# Altium schematic sheet HDMI_Sheet.SchDoc
size A4; DocumentNumber: 12; SheetNumber: 12; SheetTotal: 27
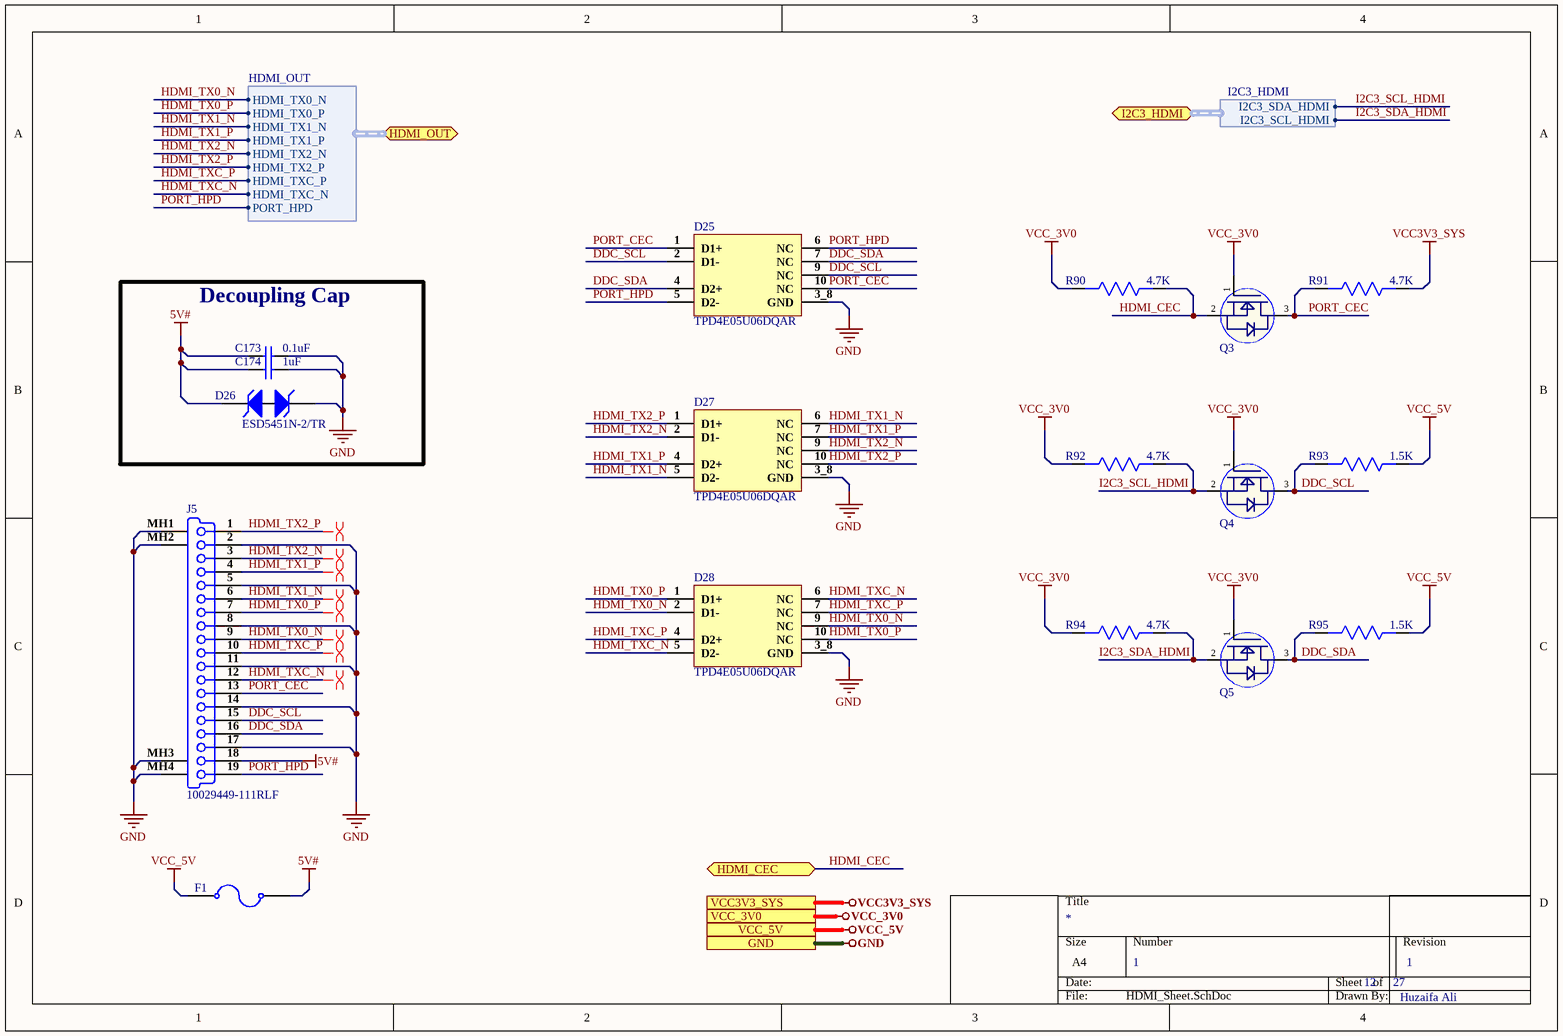
[diagram p0: HDMI_Sheet.SchDoc]

## Parts
C173  0.1uF  [Cap0402]
C174  1uF  [Cap0402]
D25  TPD4E05U06DQAR  [uSON-10]
D26  ESD5451N-2/TR  [DFN1006-2L]
D27  TPD4E05U06DQAR  [uSON-10]
D28  TPD4E05U06DQAR  [uSON-10]
F1  SMD0603-050  [Fuse 0603]  (value not drawn)
J5  10029449-111RLF  [10029449-111RLF]
Q3  WNM6001-3/TR  [SOT23-3]  (value not drawn)
Q4  WNM6001-3/TR  [SOT23-3]  (value not drawn)
Q5  WNM6001-3/TR  [SOT23-3]  (value not drawn)
R90  4.7K  [Res0603]
R91  4.7K  [Res0603]
R92  4.7K  [Res0603]
R93  1.5K  [Res0603]
R94  4.7K  [Res0603]
R95  1.5K  [Res0603]

## Blocks framed on the sheet
Decoupling Cap: C173 C174 D26

## Ports
GND, HDMI_CEC (bidir), HDMI_OUT (bidir, harness HDMI_OUT), I2C3_HDMI (bidir, harness I2C3_HDMI), VCC3V3_SYS, VCC_3V0, VCC_5V

## Harnesses
I2C3_HDMI: I2C3_SCL_HDMI, I2C3_SDA_HDMI
HDMI_OUT: HDMI_TX0_N, HDMI_TX0_P, HDMI_TXC_P, HDMI_TXC_N, HDMI_TX1_N, HDMI_TX1_P, HDMI_TX2_N, HDMI_TX2_P, PORT_HPD

## Nets
5V#: C173.1 C174.1 D26.1(K) F1.2 J5.18
GND: C173.2 C174.2 D25.3_8(GND) D26.2(k) D27.3_8(GND) D28.3_8(GND) J5.2 J5.5 J5.8 J5.11 J5.14 J5.17 J5.MH1(Tab) J5.MH2(Tab) J5.MH3(Tab) J5.MH4(Tab) ; port GND
VCC3V3_SYS: R91.1 ; port VCC3V3_SYS
VCC_3V0: Q3.1(G) Q4.1(G) Q5.1(G) R90.2 R92.2 R94.2 ; port VCC_3V0
VCC_5V: F1.1 R93.1 R95.1 ; port VCC_5V
DDC_SCL: D25.2(D1-) D25.9(NC) J5.15 Q4.3(D) R93.2
DDC_SDA: D25.4(D2+) D25.7(NC) J5.16 Q5.3(D) R95.2
HDMI_CEC: Q3.2(S) R90.1 ; port HDMI_CEC
HDMI_TX0_N: D28.2(D1-) D28.9(NC) J5.9 ; port HDMI_OUT.HDMI_TX0_N
HDMI_TX0_P: D28.1(D1+) D28.10(NC) J5.7 ; port HDMI_OUT.HDMI_TX0_P
HDMI_TX1_N: D27.5(D2-) D27.6(NC) J5.6 ; port HDMI_OUT.HDMI_TX1_N
HDMI_TX1_P: D27.4(D2+) D27.7(NC) J5.4 ; port HDMI_OUT.HDMI_TX1_P
HDMI_TX2_N: D27.2(D1-) D27.9(NC) J5.3 ; port HDMI_OUT.HDMI_TX2_N
HDMI_TX2_P: D27.1(D1+) D27.10(NC) J5.1 ; port HDMI_OUT.HDMI_TX2_P
HDMI_TXC_N: D28.5(D2-) D28.6(NC) J5.12 ; port HDMI_OUT.HDMI_TXC_N
HDMI_TXC_P: D28.4(D2+) D28.7(NC) J5.10 ; port HDMI_OUT.HDMI_TXC_P
I2C3_SCL_HDMI: Q4.2(S) R92.1 ; port I2C3_HDMI.I2C3_SDA_HDMI
I2C3_SDA_HDMI: Q5.2(S) R94.1 ; port I2C3_HDMI.I2C3_SCL_HDMI
PORT_CEC: D25.1(D1+) D25.10(NC) J5.13 Q3.3(D) R91.2
PORT_HPD: D25.5(D2-) D25.6(NC) J5.19 ; port HDMI_OUT.PORT_HPD

## Layout directives
differential pair; net class HDMI_TX2; differential pair class HDMI_Lines; rule Impedance Constraint [Min = 85.00    Max = 90.00    ]; rule Matched Net Lengths [Tolerance = 50mil]: HDMI_TX2_P
differential pair; differential pair class HDMI_Lines; net class HDMI_TX2; rule Matched Net Lengths [Tolerance = 50mil]; rule Impedance Constraint [Min = 85.00    Max = 90.00    ]: HDMI_TX2_N
differential pair; differential pair class HDMI_Lines; net class HDMI_TX1; rule Matched Net Lengths [Tolerance = 50mil]; rule Impedance Constraint [Min = 85.00    Max = 90.00    ]: HDMI_TX1_N, HDMI_TX1_P
differential pair; differential pair class HDMI_Lines; net class HDMI_TX0; rule Matched Net Lengths [Tolerance = 50mil]; rule Impedance Constraint [Min = 85.00    Max = 90.00    ]: HDMI_TX0_N, HDMI_TX0_P
differential pair; differential pair class HDMI_Lines; net class HDMI_TXC; rule Impedance Constraint [Min = 85.00    Max = 90.00    ]; rule Matched Net Lengths [Tolerance = 50mil]: HDMI_TXC_P
differential pair; differential pair class HDMI_Lines; net class HDMI_TXC; rule Matched Net Lengths [Tolerance = 50mil]; rule Impedance Constraint [Min = 85.00    Max = 90.00    ]: HDMI_TXC_N

## Notes on the sheet
- 1
- Huzaifa Ali

## Library data of the parts
C173 = CC0402KRX5R6BB104: CAP CER 0.1UF 10V X5R 0402; Manufacturer: Yageo; Capacitance: 100nF; Tolerance: 10%; Dissipation Factor: 5%; Insulation Resistance: 10GR; Supplier 1: Digi-Key; Manufacturer Part Number: CC0402KRX5R6BB104; RoHS: Yes; Category: Ceramic Capacitors; Stock 1: 6385580; Pricing 1: 1=0.10000, 10=0.02700, 50=0.01500, 100=0.01220, 500=0.00874, 1000=0.00687, 2500=0.00625, 5000=0.00575 (USD); Mount: Surface Mount; Case/Package: 0402; Number of Pins: 2; Case Code (Imperial): 0402; Case Code (Metric): 1005; Min Operating Temperature: -55°C; Max Operating Temperature: 85°C; Dielectric: X5R; Packaging: Tape and Reel; Voltage Rating: 10V; Package Quantity: 1; Termination: SMD/SMT; Voltage Rating (DC): 10V; Series: CC; Length: 1mm; Width: 0.02inch; Height: 0.5mm; Depth: 0.5mm; Thickness: 0.022inch; Radiation Hardening: No; RoHS Compliant: Yes; REACH SVHC: No SVHC; Lead Free: Lead Free; Halogen Free: Halogen Free; ComponentLink1URL: https://datasheet.ciiva.com/144/mlccorderingcode-144029.pdf?src-supplier=Digi-Key; ComponentLink1Description: https://datasheet.ciiva.com/144/mlccorderingcode-144029.pdf?src-supplier=Digi-Key; ComponentLink2URL: https://datasheet.ciiva.com/144/mlccorderingcode-144028.pdf?src-supplier=Digi-Key; ComponentLink2Description: https://datasheet.ciiva.com/144/mlccorderingcode-144028.pdf?src-supplier=Digi-Key; ComponentLink3URL: https://datasheet.ciiva.com/144/mlccorderingcode-144030.pdf?src-supplier=Digi-Key; ComponentLink3Description: https://datasheet.ciiva.com/144/mlccorderingcode-144030.pdf?src-supplier=Digi-Key; ComponentLink4URL: https://datasheet.ciiva.com/7978/1359354-7978091.pdf?src-supplier=Element14; ComponentLink4Description: https://datasheet.ciiva.com/7978/1359354-7978091.pdf?src-supplier=Element14; ComponentLink5URL: https://datasheet.ciiva.com/11587/upy-gphc-x5r-4v-to-50v-12-11587302.pdf?src-supplier=Avnet; ComponentLink5Description: https://datasheet.ciiva.com/11587/upy-gphc-x5r-4v-to-50v-12-11587302.pdf?src-supplier=Avnet; Supplier Part Number 1: 311-1336-1-ND
C174 = GRM155R61E105KA12D: CAP CER 1UF 25V X5R 0402; Manufacturer: Murata; Material: Ceramic; Tolerance: 10%; Supplier 1: Digi-Key; Manufacturer Part Number: GRM155R61E105KA12D; Stock 1: 1194305; Pricing 1: 1=0.11, 10=0.077, 100=0.0363, 500=0.02546, 1000=0.02108, 2500=0.01962, 5000=0.01795 (USD); Mount: Surface Mount; Case/Package: 0402; Weight: 0.000212oz; Case Code (Metric): 1005; Case Code (Imperial): 0402; Min Operating Temperature: -55°C; Max Operating Temperature: 85°C; Capacitance: 1uF; Voltage Rating: 25V; Packaging: Tape and Reel; Dielectric: X5R; Voltage: 25V; Termination: SMD/SMT; Voltage Rating (DC): 25V; Package Quantity: 10000; Length: 1mm; Height: 0.5mm; Width: 0.5mm; Thickness: 0.022inch; Depth: 0.5mm; REACH SVHC: No SVHC; Lead Free: Lead Free; ComponentLink1URL: http://www.farnell.com/datasheets/2048341.pdf?src-supplier=Element14; ComponentLink1Description: http://www.farnell.com/datasheets/2048341.pdf?src-supplier=Element14; Supplier Part Number 1: 490-10017-1-ND
D25 D27 D28 = TPD4E05U06DQAR: uSON-10 ESD Protection Devices ROHS; Manufacturer: TECH PUBLIC; ComponentLink1Description: LCSC; ComponentLink1URL: https://lcsc.com/product-detail/ESD-Protection-Devices_TECH-PUBLIC-TPD4E05U06DQAR_C2827646.html; Manufacturer Part Number: TPD4E05U06DQAR
D26 = ESD5451N-2/TR: DFN1006-2L ESD Protection Devices ROHS; Manufacturer: WILLSEMI; ComponentLink1Description: LCSC; ComponentLink1URL: https://www.lcsc.com/product-detail/TVS_Will-Semicon-ESD5451N-2-TR_C239604.html; Manufacturer Part Number: ESD5451N-2/TR
F1 = SMD0603-050: 6V 500mA 40A 1A 0603 Resettable Fuses ROHS; Manufacturer: TECHFUSE; Supplier 1: LCSC; Manufacturer Part Number: SMD0603-050; RoHS: No; Category: Uncategorized; Supplier Part Number 1: C69679
J5 = 10029449-111RLF: CONN RCPT 1.4 HDMI 19POS SMD R/A; Manufacturer: Amphenol ICC / FCI; Supplier 1: RSComponents; Manufacturer Part Number: 10029449-111RLF; RoHS: No; Category: Audio / Video Connectors; Stock 1: 6150; Pricing 1: 1=1471.56000 (GBP); ComponentLink1URL: https://www.verical.com/server-webapp/html/getDatasheet?partID=416866&src-supplier=Verical; ComponentLink1Description: https://www.verical.com/server-webapp/html/getDatasheet?partID=416866&src-supplier=Verical; ComponentLink2URL: http://components.arrow.com/part/dataview/51683435S9285512N8314?src-supplier=Arrow+Electronics; ComponentLink2Description: http://components.arrow.com/part/dataview/51683435S9285512N8314?src-supplier=Arrow+Electronics; ComponentLink3URL: http://portal.fciconnect.com/Comergent/en/US/adirect/fci?cmd=catProductDetail&showAddButton=true&productID=10029449111RLF&src-supplier=Mouser; ComponentLink3Description: http://portal.fciconnect.com/Comergent/en/US/adirect/fci?cmd=catProductDetail&showAddButton=true&productID=10029449111RLF&src-supplier=Mouser; ComponentLink4URL: http://www.amphenol-icc.com/media/wysiwyg/files/drawing/10029449.pdf?src-supplier=Digi-Key; ComponentLink4Description: http://www.amphenol-icc.com/media/wysiwyg/files/drawing/10029449.pdf?src-supplier=Digi-Key; ComponentLink5URL: http://www.farnell.com/datasheets/2562284.pdf?src-supplier=Farnell; ComponentLink5Description: http://www.farnell.com/datasheets/2562284.pdf?src-supplier=Farnell; Supplier Part Number 1: 1822113
Q3-Q5 = WNM6001-3/TR: 60V 500mA 690mW 2Ω@10V,500mA 2V@250uA N Channel SOT-23 MOSFETs ROHS; Manufacturer: WILLSEMI; ComponentLink1Description: LCSC; ComponentLink1URL: https://www.lcsc.com/product-detail/MOSFETs_WILLSEMI-Will-Semicon-WNM6001-3-TR_C239589.html; Manufacturer Part Number: WNM6001-3/TR; Footprint: SOT-23
R90-R92 R94 = RC0603JR-074K7L: RES SMD 4.7K OHM 5% 1/10W 0603; Manufacturer: Yageo; Resistance: 4.7kR; Temperature Coefficient: 100ppm/°C; Voltage Rating (DC): 50V; Power Rating: 100mW; Supplier 1: Digi-Key; Manufacturer Part Number: RC0603JR-074K7L; Stock 1: 19706643; Pricing 1: 1=0.1, 10=0.02, 100=0.0081, 1000=0.00362, 2500=0.00314 (USD); Case/Package: 0603; Number of Pins: 2; Case Code (Imperial): 0603; Case Code (Metric): 1608; Min Operating Temperature: -55°C; Max Operating Temperature: 155°C; Tolerance: 5%; Composition: Thick Film; Packaging: Tape and Reel; Voltage Rating: 50V; Termination: SMD/SMT; Military Standard: Not; Length: 1.6mm; Width: 0.8mm; Depth: 0.8mm; REACH SVHC: No SVHC; Lead Free: Lead Free; ComponentLink1URL: http://www.farnell.com/datasheets/443971.pdf?src-supplier=Element14; ComponentLink1Description: http://www.farnell.com/datasheets/443971.pdf?src-supplier=Element14; Supplier Part Number 1: 311-4.7KGRCT-ND
R93 R95 = AF0603FR-071K5L: RES SMD 1.5K OHM 1% 1/10W 0603; Manufacturer: Yageo; Resistance: 1.5kR; Max Power Dissipation: 100mW; Temperature Coefficient: 100ppm/°C; Supplier 1: Digi-Key; Manufacturer Part Number: AF0603FR-071K5L; RoHS: Yes; Category: Chip SMD Resistors; Stock 1: 10444; Pricing 1: 1=0.10000, 10=0.05800, 100=0.02360, 1000=0.01061, 2500=0.00921 (USD); Case/Package: 0603; Min Operating Temperature: -55°C; Max Operating Temperature: 155°C; Packaging: Tape and Reel; Resistor Type: Thick Film; Number of Terminations: 2; Tolerance: 1%; Features: Moisture Resistant,Anti-Sulfur; Length: 0.063inch; Width: 0.031inch; Height: 0.022inch; RoHS Compliant: Yes; ComponentLink1URL: http://www.yageo.com/documents/recent/PYu-AF_51_RoHS_L_5.pdf?src-supplier=Digi-Key; ComponentLink1Description: http://www.yageo.com/documents/recent/PYu-AF_51_RoHS_L_5.pdf?src-supplier=Digi-Key; Supplier Part Number 1: 13-AF0603FR-071K5LCT-ND